# Altium schematic sheet ECG_PCB_Power.SchDoc
size B; SheetNumber: 1; SheetTotal: 2
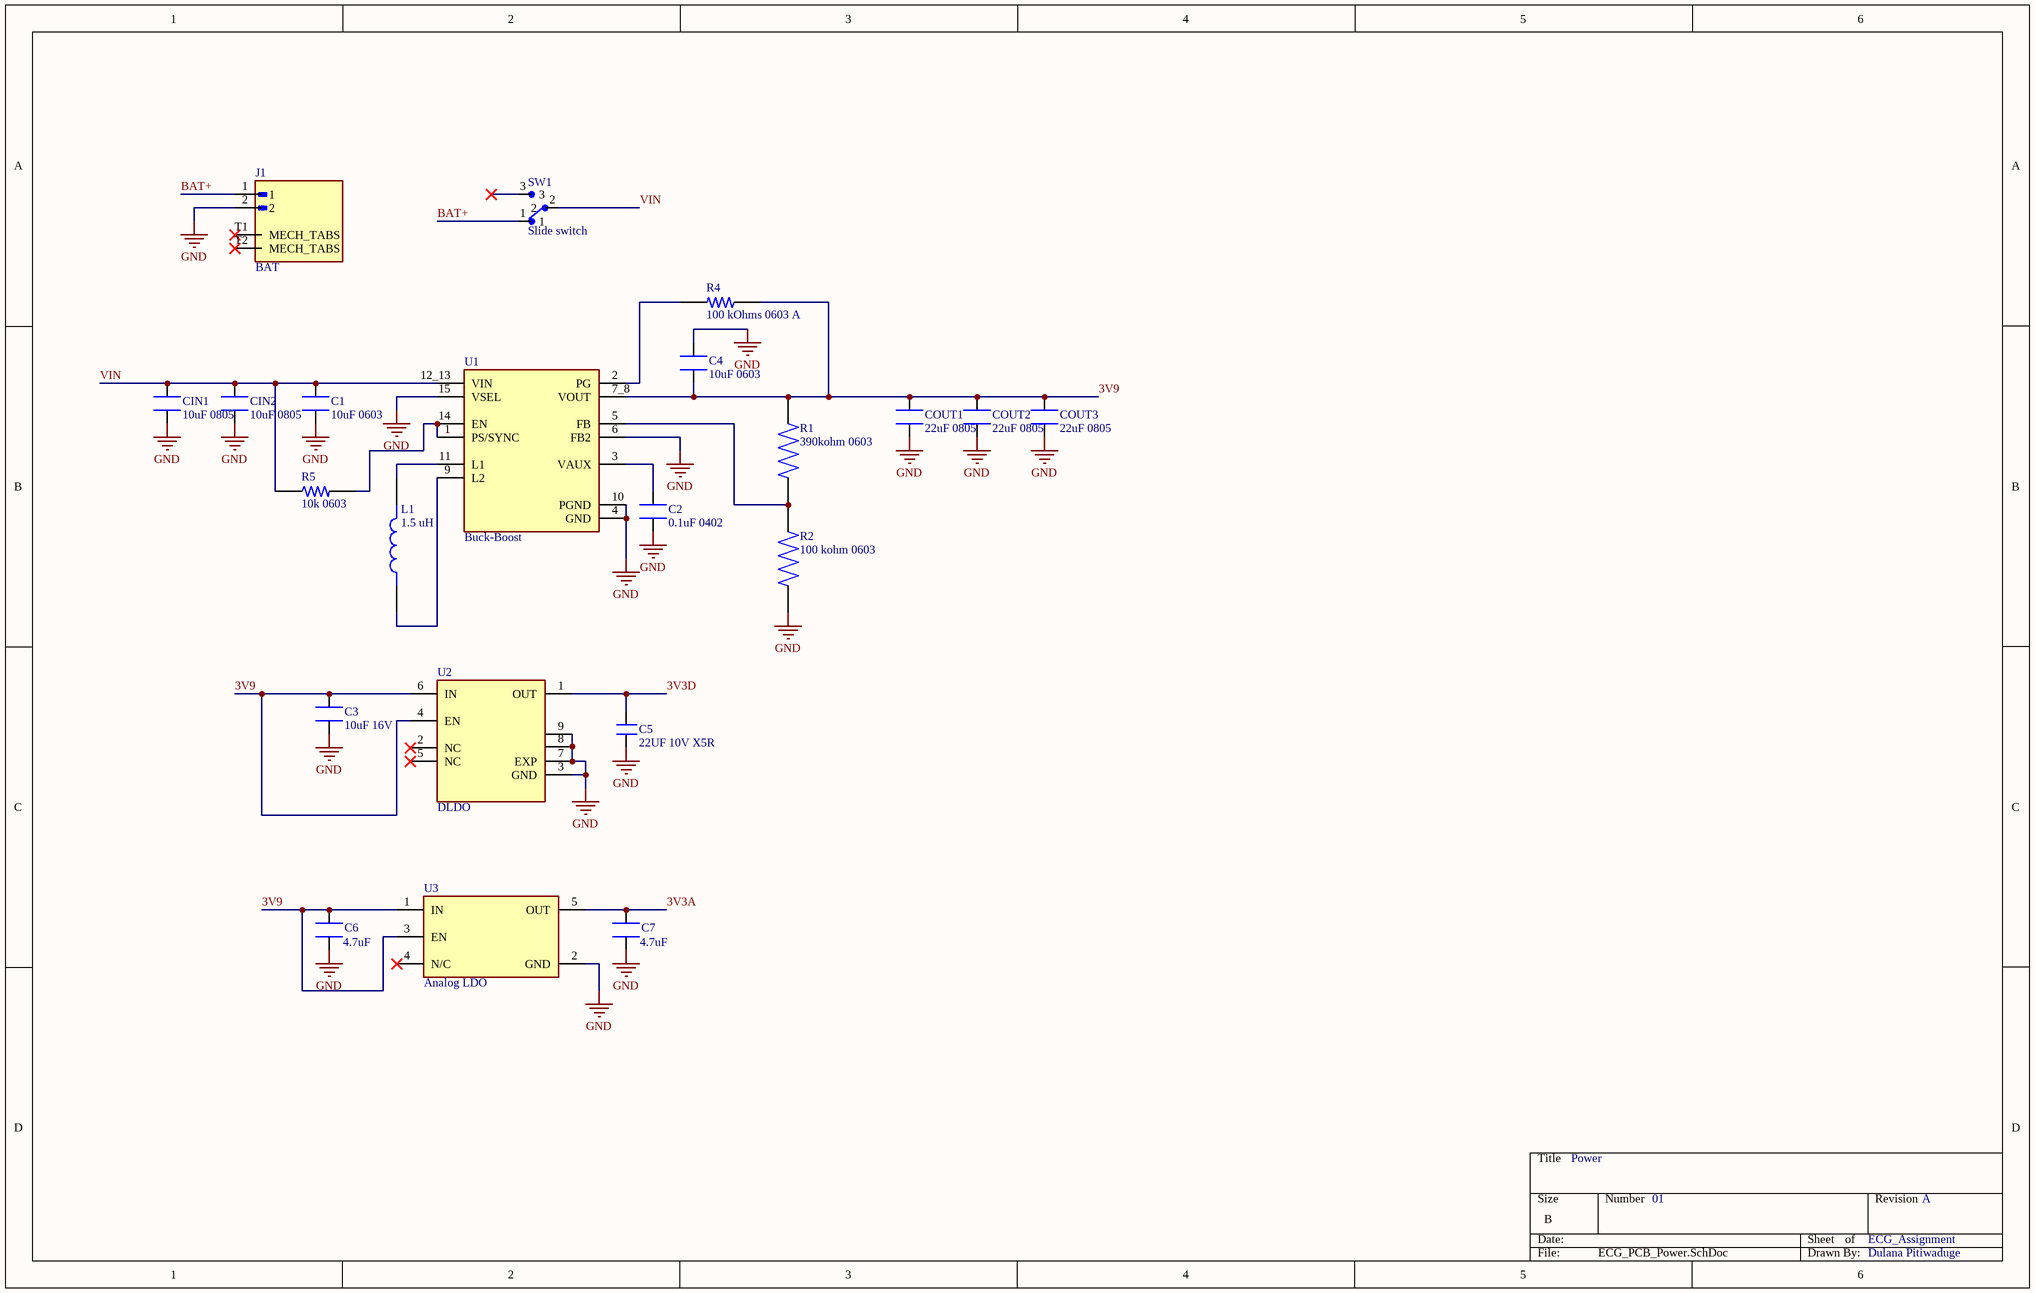
[diagram p0: ECG_PCB_Power.SchDoc]

## Parts
C1  10uF 0603  [CAPC1608X100N]
C2  0.1uF 0402  [CAPC1005X55N]
C3  10uF 16V  [CAPC2012X135N]
C4  10uF 0603  [CAPC1608X100N]
C5  22UF 10V X5R  [CAP_GRM21B_MUR]
C6  4.7uF  [CAPC2012X135N]
C7  4.7uF  [CAPC2012X135N]
CIN1  10uF 0805  [CAPC2012X145N]
CIN2  10uF 0805  [CAPC2012X145N]
COUT1  22uF 0805  [CAPC2012X145N]
COUT2  22uF 0805  [CAPC2012X145N]
COUT3  22uF 0805  [CAPC2012X145N]
J1  BAT  [JST_S2B-PH-SM4-TB]
L1  1.5 uH  [IND_XFL4020-152MEC]
R1  390kohm 0603  [RESC1608X55N]
R2  100 kohm 0603  [RESC1508X50N]
R4  100 kOhms 0603 A  [RESC1607X60N]
R5  10k 0603  [RESC1607X60N]
SW1  Slide switch  [SW_1101M2S3CQE2]
U1  Buck-Boost  [VREG_TPS63070RNMR]
U2  DLDO  [VREG_TLV75733PDRVR]
U3  Analog LDO  [SOT95P280X145-5N]

## Nets
GND: C1.1 C2.1 C3.1 C4.1 C5.1 C6.2 C7.2 CIN1.1 CIN2.1 COUT1.1 COUT2.1 COUT3.1 J1.2 R2.1 U1.4(GND) U1.6(FB2) U1.10(PGND) U1.15(VSEL) U2.3(GND) U2.7(EXP) U2.8 U2.9(OUT) U3.2(GND)
3V3A: C7.1 U3.5(OUT)
3V3D: C5.2 U2.1(OUT)
3V9: C3.2 C4.2 C6.1 COUT1.2 COUT2.2 COUT3.2 R1.2 R4.1 U1.7_8(VOUT) U2.4(EN) U2.6(IN) U3.1(IN) U3.3(EN)
BAT+: J1.1 SW1.1
VIN: C1.2 CIN1.2 CIN2.2 R5.1 SW1.2 U1.12_13(VIN)
NetC2_2: C2.2 U1.3(VAUX)
NetL1_1: L1.1 U1.9(L2)
NetL1_2: L1.2 U1.11(L1)
NetR1_1: R1.1 R2.2 U1.5(FB)
NetR4_2: R4.2 U1.2(PG)
NetR5_2: R5.2 U1.1(PS/SYNC) U1.14(EN)

Not connected (* = marked no-connect by the designer): J1 T1(MECH_TABS)* T2(MECH_TABS)*; SW1 3*; U2 2(NC)* 5(NC)*; U3 4(N/C)*

## Notes on the sheet
- Power
- 01
- ECG_Assignment
- A
- Dulana Pitiwaduge

## Library data of the parts
C1 C4 = MSAST168BB5106MTNA01: 10uF 25V 20% Multilayer Ceramic Capacitor X5R 0603 (1608 Metric); MANUFACTURER: Taiyo Yuden; MAXIMUM_PACKAGE_HEIGHT: 1.00mm; Package: 1608-2 TAIYO; MPN: MSAST168BB5106MTNA01; Value: *; SOURCE_URL: https://www.snapeda.com/parts/MSAST168BB5106MTNA01/Taiyo+Yuden/view-part/; DATASHEET_URL: https://snapeda.s3.amazonaws.com/datasheet/Taiyo_Yuden_MLCC_S.pdf; STANDARD: IPC-7351B
C2 = MSAST105SB7104MFNB25: CAP CER 0.1UF 25V X7R 0402; MANUFACTURER: Taiyo Yuden; MPN: MSAST105SB7104MFNB25; MAXIMUM_PACKAGE_HEIGHT: 0.55mm; Value: *; STANDARD: IPC-7351B
C3 = GRM21BR61C106KE15L: 10 ÂµF Â±10% 16V Ceramic Capacitor X5R 0805 (2012 Metric); MF: Murata; SnapEDA_Link: https://www.snapeda.com/parts/GRM21BR61C106KE15L/Murata/view-part/?ref=snap; Package: 805-2 Murata; Value: *; MP: GRM21BR61C106KE15L; Check_prices: https://www.snapeda.com/parts/GRM21BR61C106KE15L/Murata/view-part/?ref=eda
C5 = GRM21BR61A226ME44L: CAP CER 22UF 10V X5R 0805; Manufacturer_Name: Murata; Type: Ceramic Capacitors; Copyright: Copyright (C) 2026 Ultra Librarian. All rights reserved.; Manufacturer_Part_Number: GRM21BR61A226ME44L
C6 C7 = GRM21BR71A475KA73L: SMD Capacitor X7R(EIA) with Capacitance: 4.7uF Tol. 10%. Rated Voltage: 10Vdc; MF: Murata; SnapEDA_Link: https://www.snapeda.com/parts/GRM21BR71A475KA73L/Murata/view-part/?ref=snap; Package: 2012 Murata; Value: *; MP: GRM21BR71A475KA73L; Check_prices: https://www.snapeda.com/parts/GRM21BR71A475KA73L/Murata/view-part/?ref=eda
CIN1 CIN2 = GRM21BC71E106ME11L: 0805 10 uF 25 V Â±20% Tolerance X7S Multilayer Ceramic Capacitor; MF: Murata; SnapEDA_Link: https://www.snapeda.com/parts/GRM21BC71E106ME11L/Murata/view-part/?ref=snap; Package: 2012 Murata; Value: *; MP: GRM21BC71E106ME11L; Check_prices: https://www.snapeda.com/parts/GRM21BC71E106ME11L/Murata/view-part/?ref=eda
COUT1-COUT3 = GRM21BC81C226ME44L: 0805 22 uF 16 V Â±20% Tolerance X6S Multilayer Ceramic Chip Capacitor; MF: Murata Electronics; SnapEDA_Link: https://www.snapeda.com/parts/GRM21BC81C226ME44L/Murata+Electronics+North+America/view-part/?ref=snap; Package: 2012 Murata; Value: *; MP: GRM21BC81C226ME44L; Check_prices: https://www.snapeda.com/parts/GRM21BC81C226ME44L/Murata+Electronics+North+America/view-part/?ref=eda
J1 = S2B-PH-SM4-TB: MANUFACTURER: JST Sales; UNIT: MM; MAXIMUM_PACKAGE_HEIGHT: 5.5mm; MPN: S2B-PH-SM4-TB; STANDARD: Manufacturer Recommendations; Value: *
L1 = XFL4020-152MEC: Inductor Power Shielded Wirewound 1.5uH 20% 100KHz 9.1A 15.8mOhm DCR 1515 Automotive Embossed Plastic T/R; MF: Coilcraft; SnapEDA_Link: https://www.snapeda.com/parts/XFL4020-152MEC/Coilcraft/view-part/?ref=snap; Package: None; Value: *; MP: XFL4020-152MEC; Check_prices: https://www.snapeda.com/parts/XFL4020-152MEC/Coilcraft/view-part/?ref=eda
R1 = RT0603BRD07390KL: 390 kOhms Â±0.1% 0.1W, 1/10W Chip Resistor 0603 (1608 Metric) Thin Film; MANUFACTURER: Yageo; Package: 1608 Yageo; MPN: RT0603BRD07390KL; DATASHEET_URL: https://s3.amazonaws.com/snapeda/datasheet/RT0603BRD07390KL_Yageo.pdf; Value: *; SOURCE_URL: https://www.snapeda.com/parts/RT0603BRD07390KL/Yageo/view-part/
R2 = CRCW0603100KFKEA: Resistor, Thick Film, 100 Kilohms, 0.1W, 1%, SMT, TCR 37 ppm/DegC, Tape and Reel | Vishay Dale CRCW0603100KFKEA; SnapEDA_Link: https://www.snapeda.com/parts/CRCW0603100KFKEA/Vishay+Dale/view-part/?ref=snap; Package: 1508 Vishay; Value: *; MF: Vishay; MP: CRCW0603100KFKEA; Check_prices: https://www.snapeda.com/parts/CRCW0603100KFKEA/Vishay+Dale/view-part/?ref=eda
R4 = RC0603FR-07100KL: 100 kOhms Â±1% 0.1W, 1/10W Chip Resistor 0603 (1608 Metric) Moisture Resistant Thick Film; MF: Yageo; SnapEDA_Link: https://www.snapeda.com/parts/RC0603FR-07100KL/Yageo/view-part/?ref=snap; Package: 0603 Yageo; Value: *; MP: RC0603FR-07100KL; Check_prices: https://www.snapeda.com/parts/RC0603FR-07100KL/Yageo/view-part/?ref=eda
R5 = RC0603FR-0710KL: 10 kOhms Â±1% 0.1W, 1/10W Chip Resistor 0603 (1608 Metric) Moisture Resistant Thick Film; MF: Yageo; SnapEDA_Link: https://www.snapeda.com/parts/RC0603FR-0710KL/Yageo/view-part/?ref=snap; Package: 0603 Yageo; Value: *; MP: RC0603FR-0710KL; Check_prices: https://www.snapeda.com/parts/RC0603FR-0710KL/Yageo/view-part/?ref=eda
SW1 = 1101M2S3CQE2: Switch,Slide,Sealed,SPDT,ON-NONE-ON,PC Mnt,.200 Blk Act,6A,120VAC,PC Thru-Hole | C&K 1101M2S3CQE2; SnapEDA_Link: https://www.snapeda.com/parts/1101M2S3CQE2/C%2526K/view-part/?ref=snap; Package: None; Value: *; MF: C&K; MP: 1101M2S3CQE2; Check_prices: https://www.snapeda.com/parts/1101M2S3CQE2/C%2526K/view-part/?ref=eda
U1 = TPS63070RNMR: Wide input voltage (2V-16V) buck-boost converter; MF: Texas Instruments; SnapEDA_Link: https://www.snapeda.com/parts/TPS63070RNMR/Texas+Instruments/view-part/?ref=snap; Package: VQFN-HR-15 Texas Instruments; Value: *; MP: TPS63070RNMR; Check_prices: https://www.snapeda.com/parts/TPS63070RNMR/Texas+Instruments/view-part/?ref=eda
U2 = TLV75733PDRVR: 1-A, low-IQ high-accuracy low-dropout (LDO) voltage regulator with enable; MF: Texas Instruments; SnapEDA_Link: https://www.snapeda.com/parts/TLV75733PDRVR/Texas+Instruments/view-part/?ref=snap; Package: WSON-6 Texas Instruments; Value: *; MP: TLV75733PDRVR; Check_prices: https://www.snapeda.com/parts/TLV75733PDRVR/Texas+Instruments/view-part/?ref=eda
U3 = TPS7A2033PDBVR: 300-mA ultra-low-noise low-IQ low-dropout (LDO) linear regulator with high PSRR; MF: Texas Instruments; SnapEDA_Link: https://www.snapeda.com/parts/TPS7A2033PDBVR/Texas+Instruments/view-part/?ref=snap; Package: SOT-23 Texas Instruments; Value: *; MP: TPS7A2033PDBVR; Check_prices: https://www.snapeda.com/parts/TPS7A2033PDBVR/Texas+Instruments/view-part/?ref=eda